# Altium project RC-Car.PrjPcb
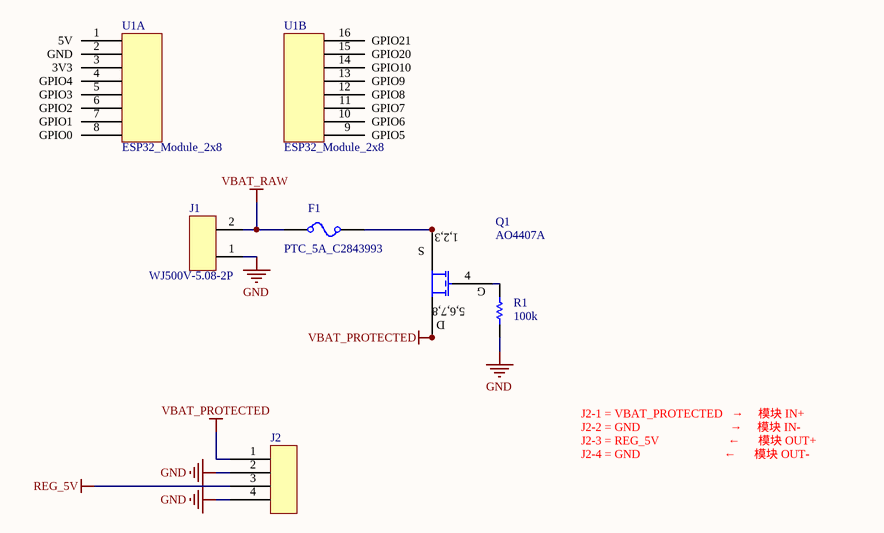
[diagram p0: RC-Car.SchDoc]
1 sheet, 6 parts. Net scope: global (net labels, ports and power ports of the same name join across sheets).

## Sheet RC-Car.SchDoc
size A4; SheetNumber: 1; SheetTotal: 2

### Parts
F1  PTC_5A_C2843993  [F1812]
J1  WJ500V-5.08-2P  [CONN-TH_2P-P5.00_WJ500V-5.08-2P]
J2  1*4连接器  [HDR-TH_4P-P2.54-V-M]  (value not drawn)
Q1  AO4407A  [SOIC-8_L4.9-W3.9-P1.27-LS6.0-BL]
R1  100k  [R0603]
U1  ESP32_Module_2x8  [HDR-TH_8P-P2.54-V-F]  (parts A,B of 2)

### Nets
GND: J1.1 J2.2 J2.4 R1.1
REG_5V: J2.3
VBAT_PROTECTED: J2.1 Q1.5(D) Q1.6(D) Q1.7(D) Q1.8(D)
VBAT_RAW : F1.1 J1.2
NetF1_2: F1.2 Q1.1(S) Q1.2(S) Q1.3(S)
NetQ1_4: Q1.4(G) R1.2

Not connected (* = marked no-connect by the designer): U1 1(5V) 2(GND) 3(3V3) 4(GPIO4) 5(GPIO3) 6(GPIO2) 7(GPIO1) 8(GPIO0) 9(GPIO5) 10(GPIO6) 11(GPIO7) 12(GPIO8) 13(GPIO9) 14(GPIO10) 15(GPIO20) 16(GPIO21)

### Notes on the sheet
- J2-1 = VBAT_PROTECTED   →     模块 IN+
  J2-2 = GND                              →     模块 IN-
  J2-3 = REG_5V                       ←      模块 OUT+
  J2-4 = GND              	             ← 	    模块 OUT-
- (in symbol AO4407A_C16072) 1,2,3; 5,6,7,8

### Library data of the parts
F1 = PTC_5A_C2843993: 贴片自恢复保险丝，保持电流5A，动作电流10A，额定电压16V，1812封装; Supplier Part Number: C2843993
J1 = TERMINAL_2P_WJ500V_C8465: 2P端子; Supplier Part Number: C8465
J2 = HEADER_1X4_P2P54_C492403: 单排4位直插公排针，2.54mm间距
Q1 = AO4407A_C16072: P沟道MOS管，电池反接保护; Supplier Part Number: C16072
R1 = R_0603: 电阻0603